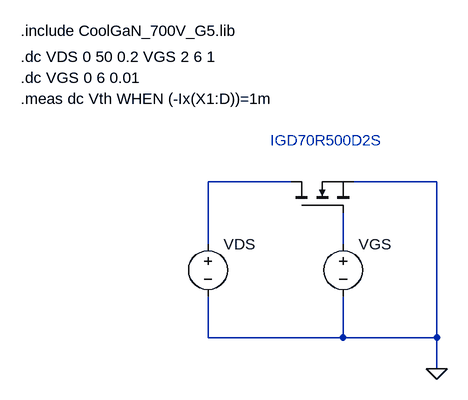
[diagram p0: schematic Static_Characteristics.asc]
Static_Characteristics.asc, the LTspice schematic file:
Version 4
SHEET 1 880 680
WIRE 32 272 -96 272
WIRE 256 272 128 272
WIRE -96 368 -96 272
WIRE 112 368 112 320
WIRE -96 512 -96 448
WIRE 112 512 112 448
WIRE 112 512 -96 512
WIRE 256 512 256 272
WIRE 256 512 112 512
WIRE 256 560 256 512
FLAG 256 560 0
SYMBOL nmos 32 320 R270
WINDOW 0 56 32 Invisible 2
WINDOW 3 56 72 Invisible 2
SYMATTR InstName X1
SYMATTR Value IGD70R500D2S_L1
SYMATTR Prefix X
SYMBOL Voltage -96 352 R0
WINDOW 3 24 96 Invisible 2
SYMATTR InstName VDS
SYMBOL Voltage 112 352 R0
WINDOW 3 24 96 Invisible 2
SYMATTR InstName VGS
TEXT 0 208 Left 2 ;IGD70R500D2S
TEXT -384 40 Left 2 !.include CoolGaN_700V_G5.lib
TEXT -384 80 Left 2 !.dc VDS 0 50 0.2 VGS 2 6 1
TEXT -384 112 Left 2 !.dc VGS 0 6 0.01
TEXT -384 144 Left 2 !.meas dc Vth WHEN (-Ix(X1:D))=1m

The netlist it stands for:
* Static_Characteristics.asc
XX1 N001 N002 0 IGD70R500D2S_L1  ; pins D G S
VDS N001 0 V
VGS N002 0 V
* IGD70R500D2S
.include CoolGaN_700V_G5.lib
.dc VDS 0 50 0.2 VGS 2 6 1
.dc VGS 0 6 0.01
.meas dc Vth WHEN (-Ix(X1:D))=1m
.backanno
.end